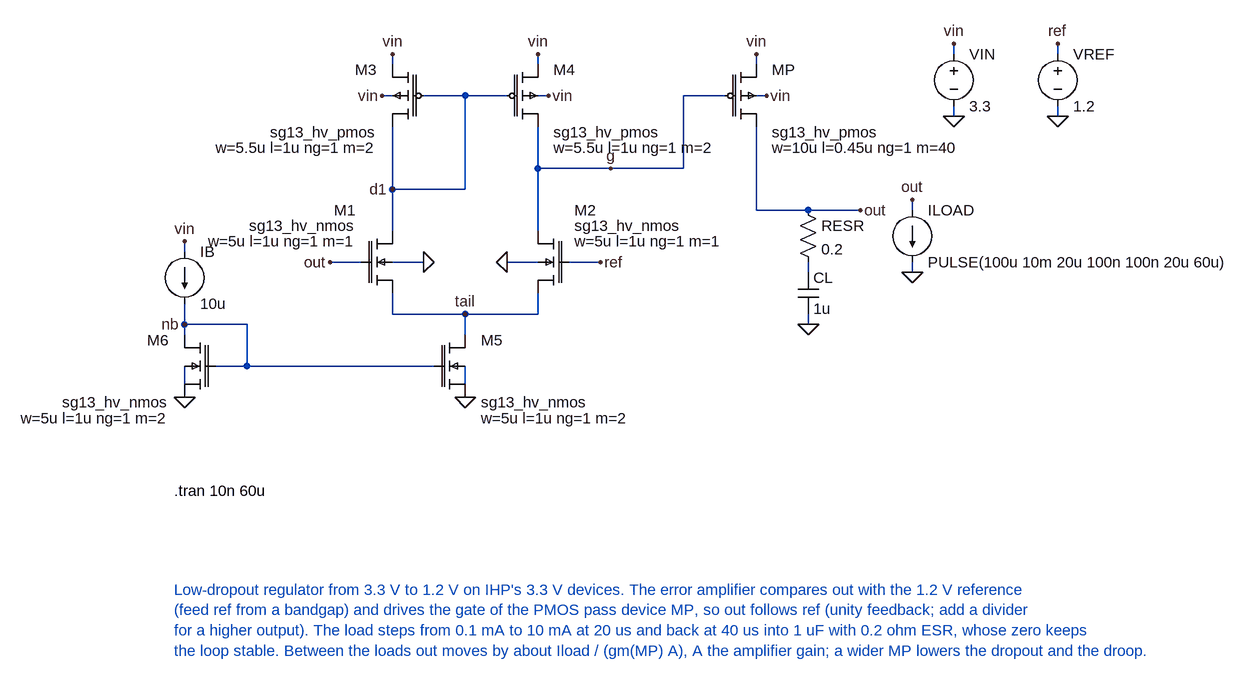
[diagram p0: schematic ldo.asc]
ldo.asc, the LTspice schematic file:
Version 4
SHEET 1 1500 1000
WIRE 240 96 240 80
WIRE 240 144 224 144
WIRE 464 96 464 80
WIRE 464 144 480 144
WIRE 288 144 416 144
WIRE 192 400 144 400
WIRE 240 400 288 400
WIRE 512 400 560 400
WIRE 464 400 416 400
WIRE 240 192 240 352
WIRE 240 288 352 288
WIRE 352 288 352 144
WIRE 464 192 464 352
WIRE 240 448 240 480
WIRE 240 480 464 480
WIRE 464 480 464 448
WIRE 352 512 352 480
WIRE -32 560 304 560
WIRE -80 384 -80 368
WIRE -80 464 -80 512
WIRE -80 496 16 496
WIRE 16 496 16 560
WIRE 352 560 352 608
WIRE -80 560 -80 608
WIRE 800 96 800 80
WIRE 800 144 816 144
WIRE 464 256 688 256
WIRE 688 256 688 144
WIRE 688 144 752 144
WIRE 800 192 800 320
WIRE 800 320 960 320
WIRE 880 400 880 416
WIRE 880 480 880 496
WIRE 1040 320 1040 304
WIRE 1040 400 1040 416
WIRE 1104 80 1104 64
WIRE 1104 160 1104 176
WIRE 1264 80 1264 64
WIRE 1264 160 1264 176
FLAG 240 80 vin
FLAG 224 144 vin
FLAG 464 80 vin
FLAG 480 144 vin
FLAG 144 400 out
FLAG 288 400 0
FLAG 560 400 ref
FLAG 416 400 0
FLAG 240 288 d1
FLAG 352 480 tail
FLAG -80 368 vin
FLAG -80 496 nb
FLAG 352 608 0
FLAG -80 608 0
FLAG 800 80 vin
FLAG 816 144 vin
FLAG 576 256 g
FLAG 960 320 out
FLAG 880 496 0
FLAG 1040 304 out
FLAG 1040 416 0
FLAG 1104 64 vin
FLAG 1104 176 0
FLAG 1264 64 ref
FLAG 1264 176 0
SYMBOL sg13g2\sg13_hv_pmos 288 96 M0
WINDOW 0 72 8 Left 2
WINDOW 3 72 104 Left 2
WINDOW 39 72 128 Left 2
SYMATTR InstName M3
SYMATTR SpiceLine w=5.5u l=1u ng=1 m=2
SYMBOL sg13g2\sg13_hv_pmos 416 96 R0
WINDOW 0 72 8 Left 2
WINDOW 3 72 104 Left 2
WINDOW 39 72 128 Left 2
SYMATTR InstName M4
SYMATTR SpiceLine w=5.5u l=1u ng=1 m=2
SYMBOL sg13g2\sg13_hv_nmos 192 352 R0
WINDOW 0 -8 -32 Right 2
WINDOW 3 -8 -8 Right 2
WINDOW 39 -8 16 Right 2
SYMATTR InstName M1
SYMATTR SpiceLine w=5u l=1u ng=1 m=1
SYMBOL sg13g2\sg13_hv_nmos 512 352 M0
WINDOW 0 -8 -32 Right 2
WINDOW 3 -8 -8 Right 2
WINDOW 39 -8 16 Right 2
SYMATTR InstName M2
SYMATTR SpiceLine w=5u l=1u ng=1 m=1
SYMBOL sg13g2\sg13_hv_nmos 304 512 R0
WINDOW 0 72 8 Left 2
WINDOW 3 72 104 Left 2
WINDOW 39 72 128 Left 2
SYMATTR InstName M5
SYMATTR SpiceLine w=5u l=1u ng=1 m=2
SYMBOL sg13g2\sg13_hv_nmos -32 512 M0
WINDOW 0 72 8 Left 2
WINDOW 3 72 104 Left 2
WINDOW 39 72 128 Left 2
SYMATTR InstName M6
SYMATTR SpiceLine w=5u l=1u ng=1 m=2
SYMBOL current -80 384 R0
SYMATTR InstName IB
SYMATTR Value 10u
SYMBOL sg13g2\sg13_hv_pmos 752 96 R0
WINDOW 0 72 8 Left 2
WINDOW 3 72 104 Left 2
WINDOW 39 72 128 Left 2
SYMATTR InstName MP
SYMATTR SpiceLine w=10u l=0.45u ng=1 m=40
SYMBOL res 864 304 R0
SYMATTR InstName RESR
SYMATTR Value 0.2
SYMBOL cap 864 416 R0
SYMATTR InstName CL
SYMATTR Value 1u
SYMBOL current 1040 320 R0
SYMATTR InstName ILOAD
SYMATTR Value PULSE(100u 10m 20u 100n 100n 20u 60u)
SYMBOL voltage 1104 64 R0
SYMATTR InstName VIN
SYMATTR Value 3.3
SYMBOL voltage 1264 64 R0
SYMATTR InstName VREF
SYMATTR Value 1.2
TEXT -96 752 Left 2 !.tran 10n 60u
TEXT -96 904 Left 2 ;Low-dropout regulator from 3.3 V to 1.2 V on IHP's 3.3 V devices. The error amplifier compares out with the 1.2 V reference\n(feed ref from a bandgap) and drives the gate of the PMOS pass device MP, so out follows ref (unity feedback; add a divider\nfor a higher output). The load steps from 0.1 mA to 10 mA at 20 us and back at 40 us into 1 uF with 0.2 ohm ESR, whose zero keeps\nthe loop stable. Between the loads out moves by about Iload / (gm(MP) A), A the amplifier gain; a wider MP lowers the dropout and the droop.

The netlist it stands for:
* ldo.asc
XM3 d1 d1 vin vin sg13_hv_pmos w=5.5u l=1u ng=1 m=2  ; pins D G S B
XM4 g d1 vin vin sg13_hv_pmos w=5.5u l=1u ng=1 m=2  ; pins D G S B
XM1 d1 out tail 0 sg13_hv_nmos w=5u l=1u ng=1 m=1  ; pins D G S B
XM2 g ref tail 0 sg13_hv_nmos w=5u l=1u ng=1 m=1  ; pins D G S B
XM5 tail nb 0 0 sg13_hv_nmos w=5u l=1u ng=1 m=2  ; pins D G S B
XM6 nb nb 0 0 sg13_hv_nmos w=5u l=1u ng=1 m=2  ; pins D G S B
IB vin nb 10u
XMP out g vin vin sg13_hv_pmos w=10u l=0.45u ng=1 m=40  ; pins D G S B
RESR out N001 0.2
CL N001 0 1u
ILOAD out 0 PULSE(100u 10m 20u 100n 100n 20u 60u)
VIN vin 0 3.3
VREF ref 0 1.2
.tran 10n 60u
* Low-dropout regulator from 3.3 V to 1.2 V on IHP's 3.3 V devices. The error amplifier compares out with the 1.2 V reference
* (feed ref from a bandgap) and drives the gate of the PMOS pass device MP, so out follows ref (unity feedback; add a divider
* for a higher output). The load steps from 0.1 mA to 10 mA at 20 us and back at 40 us into 1 uF with 0.2 ohm ESR, whose zero keeps
* the loop stable. Between the loads out moves by about Iload / (gm(MP) A), A the amplifier gain; a wider MP lowers the dropout and the droop.
.backanno
.end